# EAGLE schematic taclink (EAGLE 7.7.0)
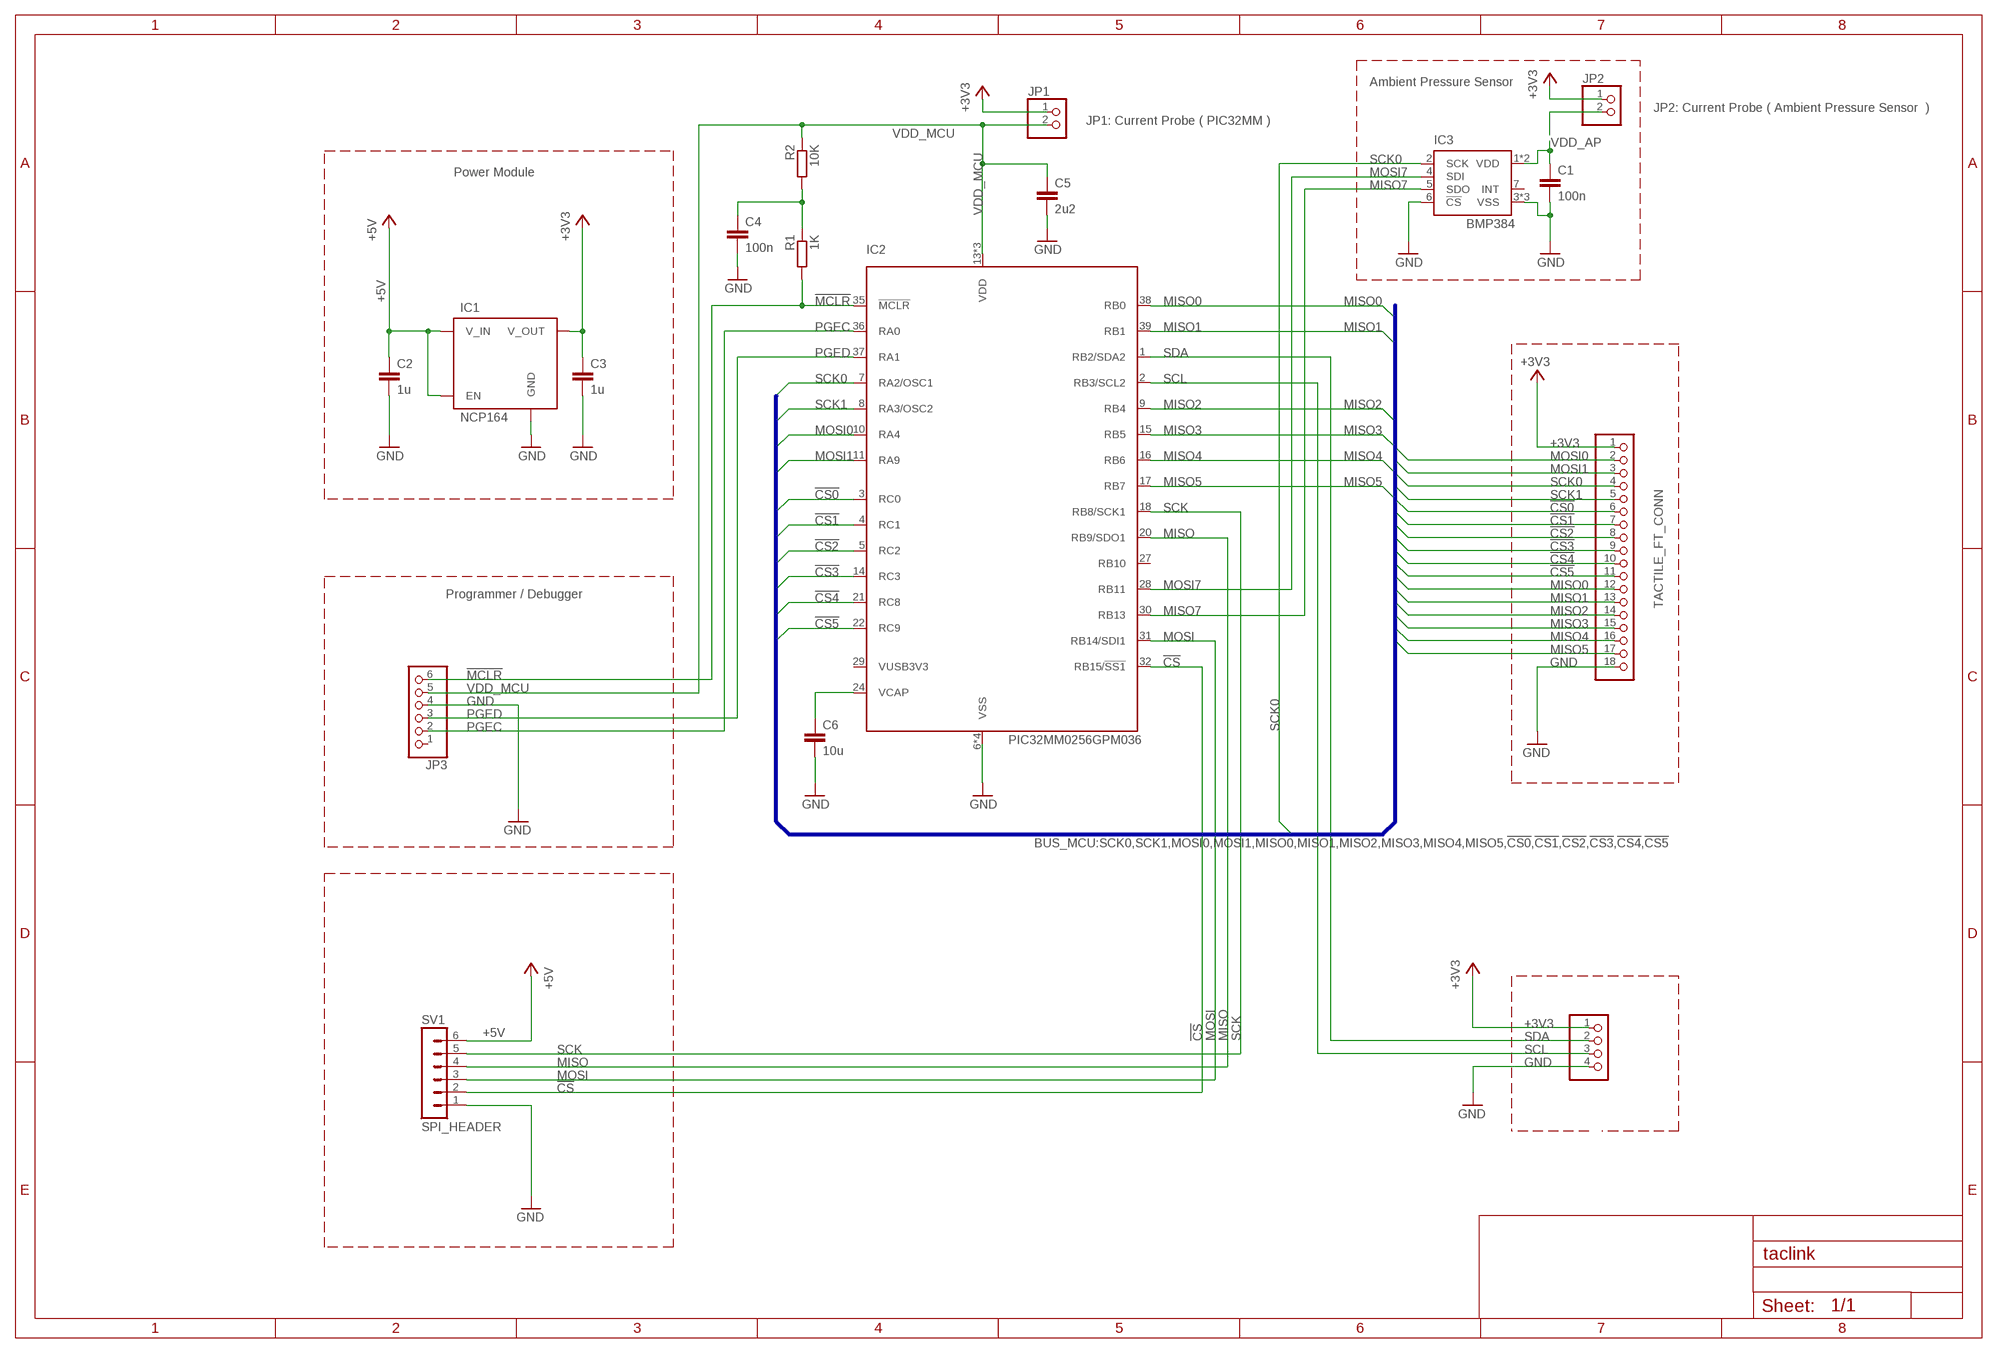
[diagram p0: schematic, sheet 1]

## Parts
ACTIVE_NAIL_CONN  PINHD-1X4/90  [1X04/90]
C1  100n  C-EUC0402  [C0402]
C2  1u  C-EUC0402  [C0402]
C3  1u  C-EUC0402  [C0402]
C4  100n  C-EUC0603  [C0603]
C5  2u2  C-EUC0402  [C0402]
C6  10u  C-EUC0402  [C0402]
IC1  NCP164  NCP164_3.3V_REGULATOR  [NCP164_3.3V_REGULATOR_TSOP5]
IC2  PIC32MM0256GPM036  PIC32MM"  [PIC32MM0256GPM036_UQFN_40PIN]
IC3  BMP384  [BMP384]
JP1  PINHD-1X2  [1X02]
JP2  PINHD-1X2  [1X02]
JP3  PINHD-1X6/90  [1X06/90]
R1  1K  R-EU_R0603  [R0603]
R2  10K  R-EU_R0603  [R0603]
SV1  SPI_HEADER  MA06-1  [MA06-1]
TACTILE_FT_CONN  PINHD-1X18/90  [1X18/90]

## Nets
!CS: IC2.32(RB15/!SS1) SV1.2
!CS0: IC2.3(RC0) TACTILE_FT_CONN.6
!CS1: IC2.4(RC1) TACTILE_FT_CONN.7
!CS2: IC2.5(RC2) TACTILE_FT_CONN.8
!CS3: IC2.14(RC3) TACTILE_FT_CONN.9
!CS4: IC2.21(RC8) TACTILE_FT_CONN.10
!CS5: IC2.22(RC9) TACTILE_FT_CONN.11
!MCLR: IC2.35(!MCLR) JP3.6 R1.2
+3V3: ACTIVE_NAIL_CONN.1 C3.1 IC1.5(V_OUT) JP1.1 JP2.1 TACTILE_FT_CONN.1
+5V: C2.1 IC1.1(V_IN) IC1.3(EN) SV1.6
GND: ACTIVE_NAIL_CONN.4 C1.2 C2.2 C3.2 C4.2 C5.2 C6.2 IC1.2(GND) IC2.6(VSS) IC2.12(VSS) IC2.33(VSS) IC2.41(VSS) IC3.3(VSS) IC3.6(!CS) IC3.8(VSS) IC3.9(VSS) JP3.4 SV1.1 TACTILE_FT_CONN.18
MISO: IC2.20(RB9/SDO1) SV1.4
MISO0: IC2.38(RB0) TACTILE_FT_CONN.12
MISO1: IC2.39(RB1) TACTILE_FT_CONN.13
MISO2: IC2.9(RB4) TACTILE_FT_CONN.14
MISO3: IC2.15(RB5) TACTILE_FT_CONN.15
MISO4: IC2.16(RB6) TACTILE_FT_CONN.16
MISO5: IC2.17(RB7) TACTILE_FT_CONN.17
MISO7: IC2.30(RB13) IC3.5(SDO)
MOSI: IC2.31(RB14/SDI1) SV1.3
MOSI0: IC2.10(RA4) TACTILE_FT_CONN.2
MOSI1: IC2.11(RA9) TACTILE_FT_CONN.3
MOSI7: IC2.28(RB11) IC3.4(SDI)
N$1: C4.1 R1.1 R2.2
N$2: C6.1 IC2.24(VCAP)
PGEC: IC2.36(RA0) JP3.2
PGED: IC2.37(RA1) JP3.3
SCK: IC2.18(RB8/SCK1) SV1.5
SCK0: IC2.7(RA2/OSC1) IC3.2(SCK) TACTILE_FT_CONN.4
SCK1: IC2.8(RA3/OSC2) TACTILE_FT_CONN.5
SCL: ACTIVE_NAIL_CONN.3 IC2.2(RB3/SCL2)
SDA: ACTIVE_NAIL_CONN.2 IC2.1(RB2/SDA2)
VDD_AP: C1.1 IC3.1(VDD) IC3.10(VDD) JP2.2
VDD_MCU: C5.1 IC2.13(VDD) IC2.26(VDD) IC2.34(VDD) JP1.2 JP3.5 R2.1
Unconnected: IC2.27(RB10) IC2.29(VUSB3V3) IC3.7(INT) JP3.1

## Buses
BUS_MCU:SCK0,SCK1,MOSI0,MOSI1,MISO0,MISO1,MISO2,MISO3,MISO4,MISO5,!CS0,!CS1,!CS2,!CS3,!CS4,!CS5

## Notes on the sheet
- Ambient Pressure Sensor
- JP2: Current Probe ( Ambient Pressure Sensor  )
- JP1: Current Probe ( PIC32MM )
- Power Module
- Programmer / Debugger

## Library data of the parts
ACTIVE_NAIL_CONN = pinhead:PINHD-1X4: PIN HEADER
C1-C6 = rcl:C-EU: CAPACITOR, European symbol
IC1 = NCP164_3V3_VOLTAGE_REGULATOR_TSOP_5:NCP164_3.3V_REGULATOR
IC2 = PIC32MM0256GPM036_UQFN_40PIN:PIC32MM
IC3 = BMP384:BMP384
JP1 JP2 = pinhead:PINHD-1X2: PIN HEADER
JP3 = pinhead:PINHD-1X6: PIN HEADER
R1 R2 = rcl:R-EU_: RESISTOR, European symbol
SV1 = con-lstb:MA06-1: PIN HEADER; OC_FARNELL: unknown; OC_NEWARK: unknown
TACTILE_FT_CONN = pinhead:PINHD-1X18: PIN HEADER